# Altium schematic sheet MAX3485Schmematic.SchDoc: Rs
size A4; DrawnBy: Yusuf Yasser; SheetNumber: 3; SheetTotal: 17
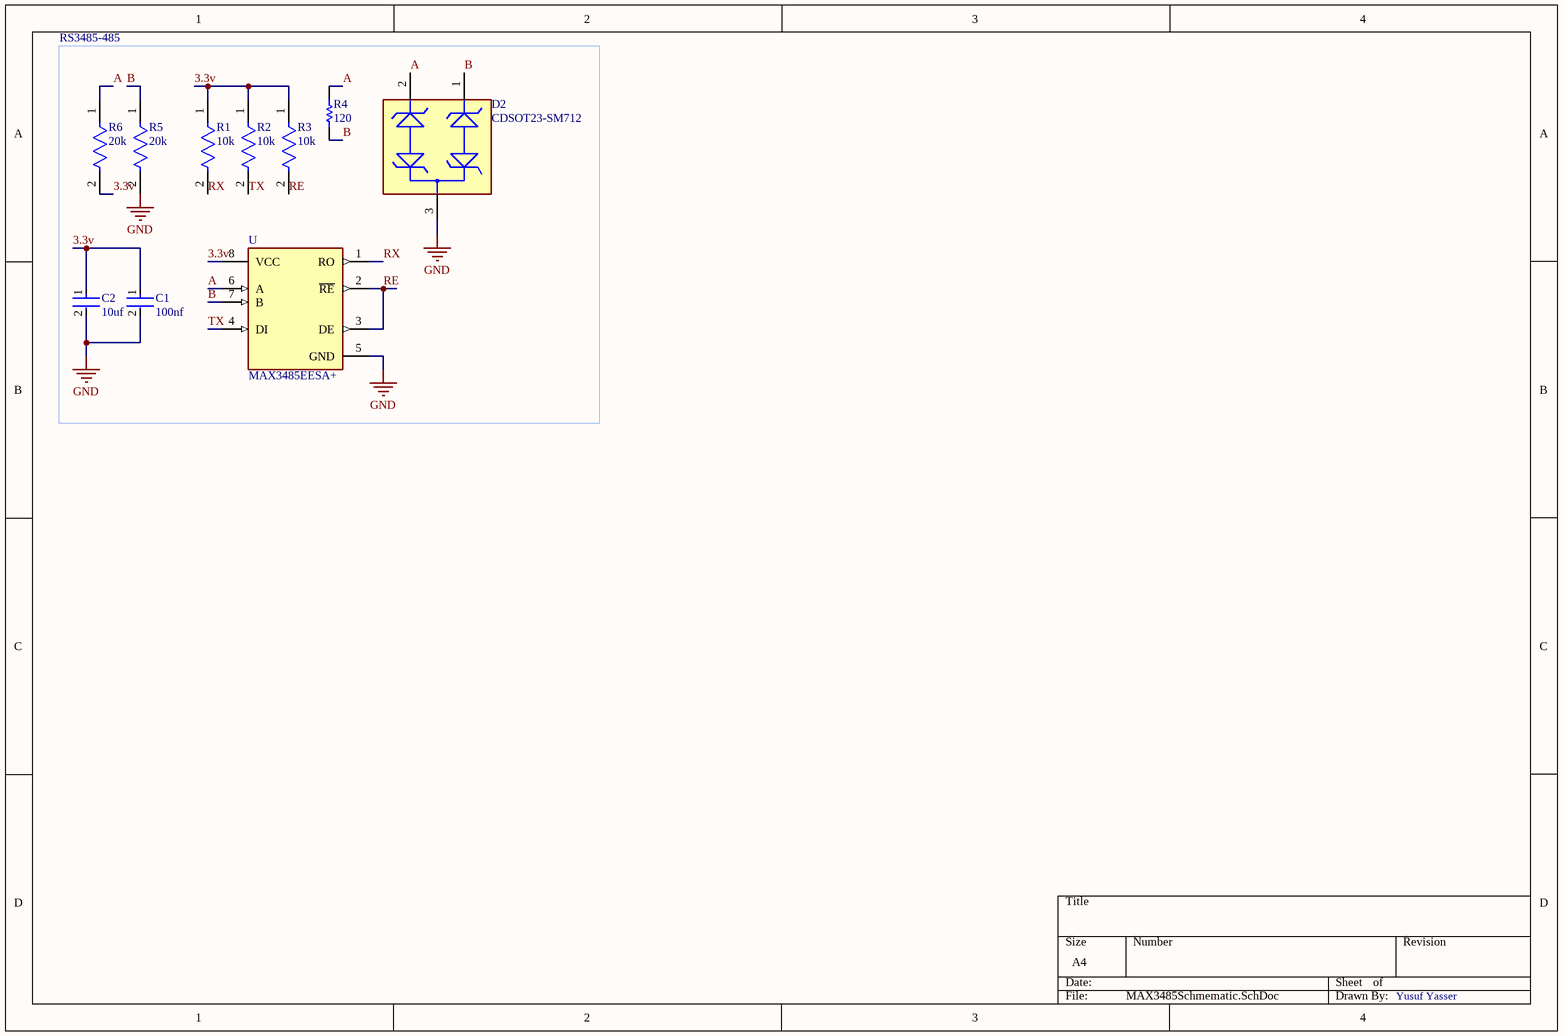
[diagram p0: MAX3485Schmematic.SchDoc]

## Parts
C1  100nf  [FP-CGA1A-0_1-0_03-IPC_A]
C2  10uf  [FP-KRM55L-6_1_5_3_3_1_2-C-MFG]
D2  CDSOT23-SM712  [FP-SOT23-MFG]
R1  10k  [FP-CRGCQ1206-IPC_C]
R2  10k  [FP-CRGCQ1206-IPC_C]
R3  10k  [FP-CRGCQ1206-IPC_C]
R4  120  [RESC3225X60X45NL20T20]
R5  20k  [FP-RP732B-MFG]
R6  20k  [FP-RP732B-MFG]
U  MAX3485EESA+  [FP-S8-5-MFG]

## Blocks framed on the sheet
RS3485-485: C1 C2 D2 R1-R6 U

## Nets
GND: C1.2 C2.2 D2.3 R5.2 U.5(GND)
3.3v: C1.1 C2.1 R1.1 R2.1 R3.1 R6.2 U.8(VCC)
A: D2.2 R4.1 R6.1 U.6(A)
B: D2.1 R4.2 R5.1 U.7(B)
RE: R3.2 U.2(~{RE}) U.3(DE)
RX: R1.2 U.1(RO)
TX: R2.2 U.4(DI)

## Notes on the sheet
- Yusuf Yasser

## Library data of the parts
C1 = CMP-08246-000333-1: AUTOMOTIVE GRADE,0201,X7T,4V,0.1
C2 = CMP-06035-048273-1: Cap Ceramic Multilayer 10uF 35V ±10% 2220 Emboss T/R
D2 = CMP-2000-05081-2: TVS DIODE 7V/12V 14V/26V SOT23-3; Manufacturer: Bourns Inc.; Peak Pulse Current: 17A; Standoff Height: 0.05mm; Breakdown Voltage: 7.5V; Direction: Bidirectional; Clamping Voltage: 26V; Value: 75pF; Number Of Channels: 2; Reverse Standoff Voltage: 12V; Peak Pulse Power: 400W; Temperature Range Low: -55°C; Mouser Description: Transient Voltage Suppressor, TVS, CDSOT23 Series, Unidirectional, 12 V, SOT-23, 3, 13.3 V; Device Class L3: unset; Package: SOT23; Height: 1.17mm; RoHS: TRUE; Octopart: https://octopart.com/cdsot23-sm712-bourns-7576327; Category: Diode; Ipc Land Pattern Name: SOT95P229X103-3; ComponentLink2URL: https://www.bourns.com/docs/Product-Datasheets/CDSOT23-SM712.pdf; Temperature Range High: +150°C; ComponentLink2Description: Datasheet; Digikey Description: TVS DIODE 7V/12V 14V/26V SOT23-3; Manufacturer Part Number: CDSOT23-SM712; Temperature: -55°C to +150°C; Device Class L2: TVS Diodes; Lead Free: Yes; Device Class L1: Circuit Protection; Automotive: No; Capacitance: 75pF
R1-R3 = CMP-03211-010884-1: CRGCQ1206 10KΩ 0.25W 1% ±100ppm/°C 200V; Manufacturer: TE Connectivity; Manufacturer Part Number: CRGCQ1206F10K; Tolerance: 0.01; Automotive Grade: Grade 913; Value: 10KΩ; Automotive: Yes; Temperature: -55°C to +155°C; RoHS: TRUE; Series: CRGCQ; Lead Free: Yes; Device Class L3: Chip SMD Resistors; Package: CRGCQ1206; ComponentLink2URL: https://www.te.com/commerce/DocumentDelivery/DDEController?Action=showdoc&DocId=Data+Sheet%7F1773204-3%7F1%7Fpdf%7FEnglish%7FENG_DS_1773204-3_1.pdf%7F4-2176347-922; Ipc Land Pattern Name: RESC310155X55; Composition: Thick Film; Voltage Rating: 200V; Device Class L1: Passive Components; Temperature Range Low: -55°C; Resistance: 10KΩ; Height: 0.65mm; Power Rating: 0.25W; Device Class L2: Resistors; Temperature Range High: +155°C; Octopart: https://octopart.com/crgcq1206f10k-te+connectivity-91018244; Ambient Temperature Range High: +70°C; ComponentLink2Description: Datasheet; Temperature Coefficient: ±100ppm/°C; Category: Res
R4 = CMP-2005-00658-1: Manufacturer: Vishay Dale; Part Number: CRCW1210120RJNTA
R5 R6 = CMP-03211-001372-1: Res Thin Film 1206 20KΩ 0.1% 0.25W 15ppm/°C Molded SMD; Manufacturer Part Number: RP73D2B20KBTG; Manufacturer: TE Connectivity; Voltage Rating: 200V; Height: 0.65mm; Ipc Land Pattern Name: RESC305155X55; octopart_url: https://octopart.com/rp73d2b20kbtg-te+connectivity-42012488; RoHS: TRUE; Value: 20KΩ; Temperature: -55°C to 155°C; packaging: 250 cut tape length; ComponentLink2Description: Datasheet; Device Class L1: Passive Components; Category: Res; Resistance: 20KΩ; Automotive: No; ComponentLink2URL: https://www.te.com/commerce/DocumentDelivery/DDEController?Action=showdoc&DocId=Data+Sheet%7F1773272%7FL%7Fpdf%7FEnglish%7FENG_DS_1773272_L.pdf%7F8-1879255-6; Composition: Thin Film; Temperature Range Low: -55°C; Device Class L3: Chip SMD Resistors; Temperature Coefficient: 15ppm/°C; Octopart: https://octopart.com/rp73d2b20kbtg-te+connectivity-42012488; Power Rating: 0.25W; Tolerance: 0.1%; Lead Free: Yes; Package: RP732B; Series: RP73; Temperature Range High: 155°C; Device Class L2: Resistors
U = CMP-05679-000038-1: IC TXRX RS485/422 10MBPS 8SOIC; Manufacturer: Maxim Integrated; Number Of Receivers: 1; Simplex Duplex: Half Duplex; Data Rate: 15Mbits/s; Interface: RS-485,RS-422; Max Supply Voltage: 3.6V; Nominal Supply Current: 0.95-1.1mA; Min Supply Voltage: 3V; Standoff Height: 0.1mm; Mouser Description: RS-422/RS-485 Interface IC 3.3V 12Mbps Transceiver; Lead Free: Yes; Footprint Url: https://pdfserv.maximintegrated.com/land_patterns/90-0096.PDF; Device Class L1: Integrated Circuits (ICs); Device Class L3: RS-232 / RS-422 / RS-485 Interface ICs; RoHS: TRUE; Height: 1.75mm; ComponentLink2URL: https://datasheets.maximintegrated.com/en/ds/MAX3483E-MAX3491E.pdf; Temperature Range High: +85°C; Temperature: -40°C to +85°C; Manufacturer Part Number: MAX3485EESA+; Number Of Transmitters: 1; Device Class L2: Interface ICs; Octopart: https://octopart.com/max3485eesa%2B-maxim+integrated-39731903; ComponentLink2Description: Datasheet; Category: IC; Digikey Description: IC TXRX RS485/422 10MBPS 8SOIC; Automotive: No; Temperature Range Low: -40°C; Package: S8-5